# Altium project AUTOLOG_PCB.PrjPcb
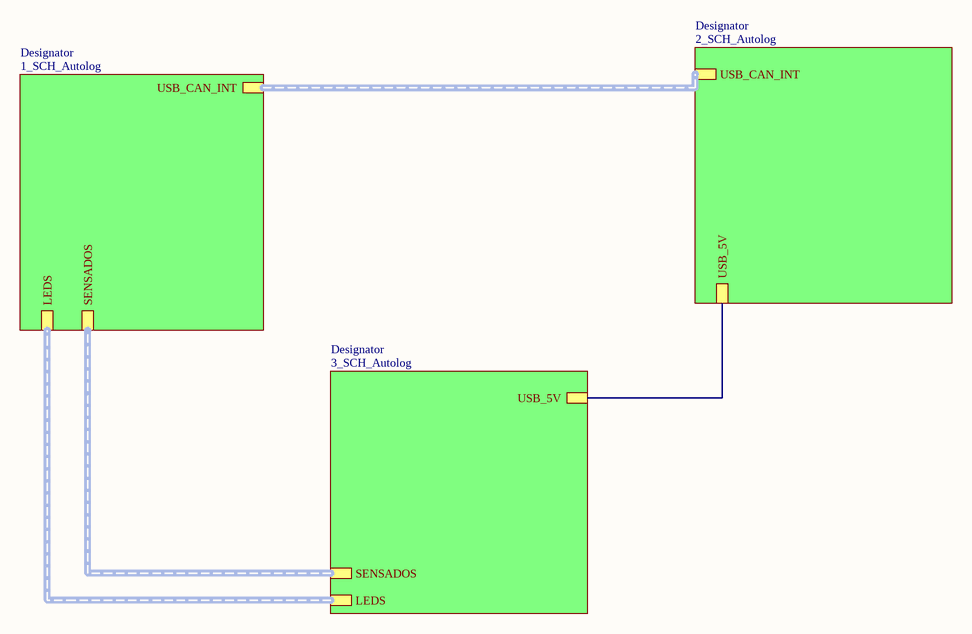
[diagram p0: Maiin.SchDoc]
4 sheets, 80 parts. Net scope: hierarchical (ports join the sheet entries above them; power ports are global).
Board file: PCB_Autolog.PcbDoc
Sheets:
  Maiin.SchDoc
    Designator = 1_SCH_Autolog.SchDoc
    Designator = 2_SCH_Autolog.SchDoc
    Designator = 3_SCH_Autolog.SchDoc

## Sheet Maiin.SchDoc: PROYECTO FINAL - AutoLog
size A4; Author: Nathalia Mora; Revision: V1R1; SheetNumber: 1; SheetTotal: 4; Name:: Marlyn Nathalia Mora Riascos

### Sub-sheets
Designator = 1_SCH_Autolog: LEDS (harness LEDS_HARNEERS), SENSADOS (harness SENSADO HARNEERS), USB_CAN_INT (harness USB_CAN_INT_HARNEERS)
Designator = 2_SCH_Autolog: USB_5V, USB_CAN_INT (harness USB_CAN_INT_HARNEERS)
Designator = 3_SCH_Autolog: LEDS (harness LEDS_HARNEERS), SENSADOS (harness SENSADO HARNEERS), USB_5V

### Nets
VBUSS: sheet Designator/USB_5V, sheet Designator/USB_5V

### Notes on the sheet
- Title
- Size:
- Date:
- A4
- Number:
- Time:
- Revision:
- Sheet
- of
- Name:
- Marlyn Nathalia Mora Riascos

## Sheet 1_SCH_Autolog.SchDoc: PROYECTO FINAL - AutoLog
size A4; Revision: V1R1; SheetNumber: 2; SheetTotal: 4
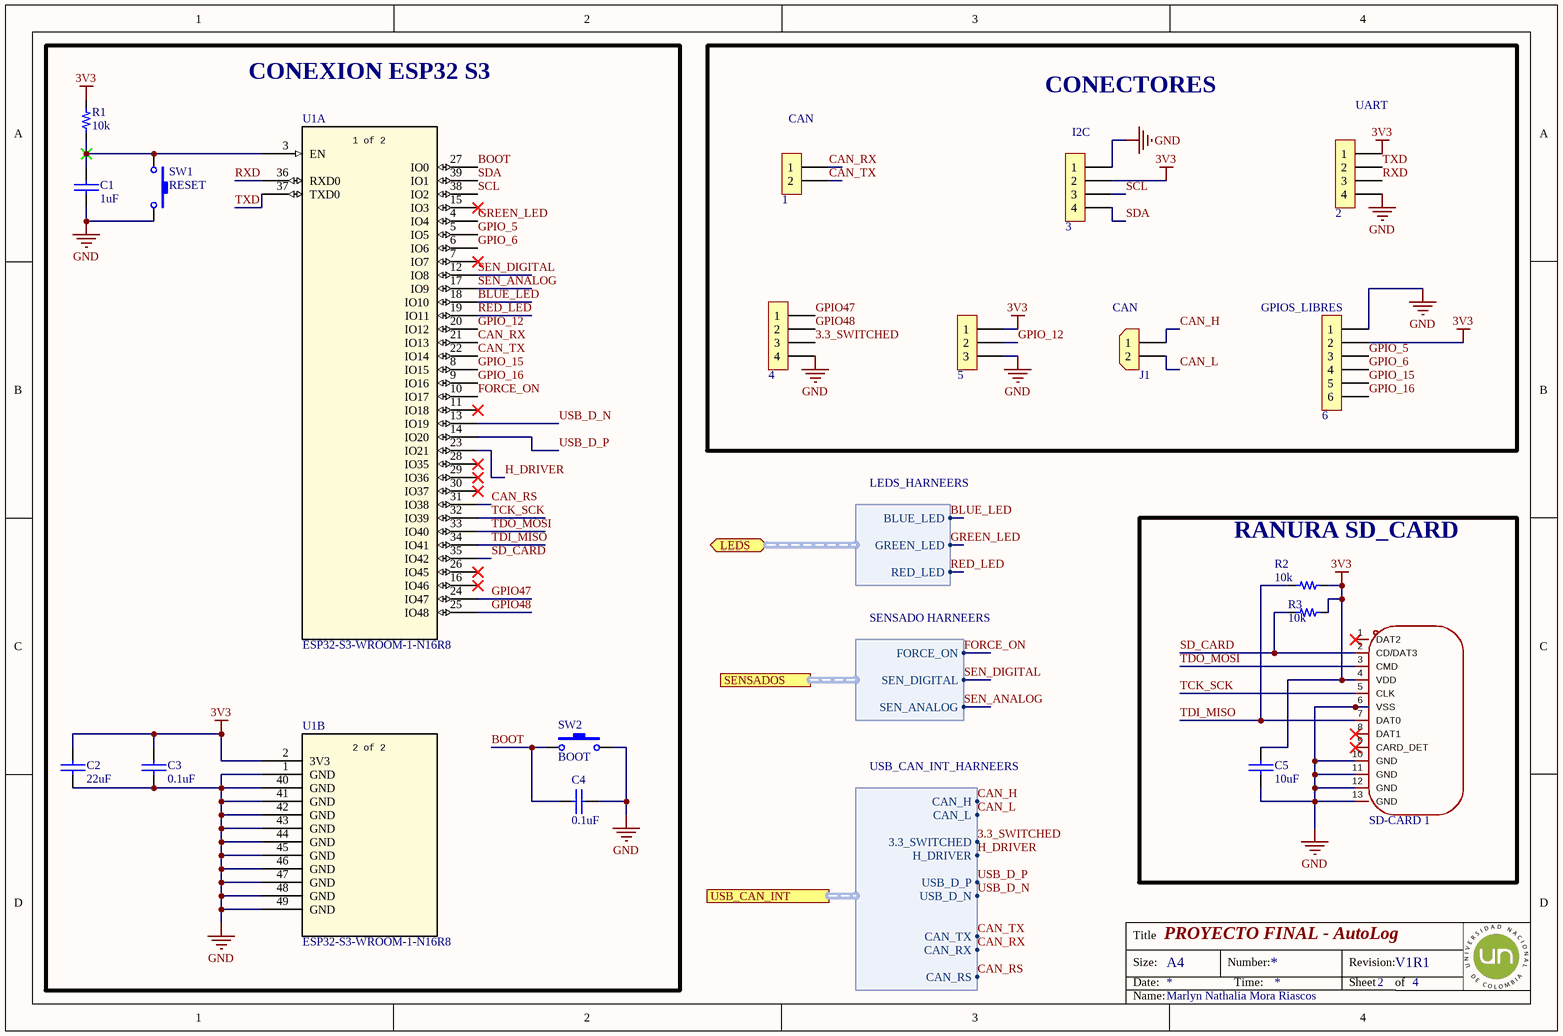
[diagram p1: 1_SCH_Autolog.SchDoc]

### Parts
1  2x1  [H_2x1_TH_100mil]  (value not drawn)  (no BOM)
2  4x1  [H_4x1_TH_2.54mm]  (value not drawn)  (no BOM)
3  4x1  [H_4x1_TH_2.54mm]  (value not drawn)  (no BOM)
4  4x1  [H_4x1_TH_2.54mm]  (value not drawn)  (no BOM)
5  3x1  [H_3X1_TH_100mil]  (value not drawn)  (no BOM)
6  6x1  [H_6x1_TH_100mil]  (value not drawn)  (no BOM)
C1  value 1uF  [0603_cap]  (hidden comment: 1uF 50V)
C2  value 22uF  [0805_cap]  (hidden comment: 22uF 16V)
C3  value 0.1uF  [0603_cap]  (hidden comment: 0.1uF 50V)
C4  value 0.1uF  [0603_cap]  (hidden comment: 0.1uF 50V)
C5  value 10uF  [0603_cap]  (hidden comment: 10uF 10V)
J1  CAN  [CON_2x1_TH_5MM]
R1  value 10k  [0603_res]  (hidden comment: 10k 1/10W)
R2  value 10k  [0603_res]  (hidden comment: 10k 1/10W)
R3  value 10k  [0603_res]  (hidden comment: 10k 1/10W)
SD-CARD_1  Micro_SD_socket  [MICROSD CARD SMD]  (value not drawn)
SW1  RESET  [Sw_PUSH_4.5x4.5x5mm]
SW2  BOOT  [Sw_PUSH_4.5x4.5x5mm]
U1  ESP32-S3-WROOM-1-N16R8  [ESP32S3WROOM1N8R2]  (parts A,B of 2)

### Blocks framed on the sheet
CONEXION ESP32 S3: C1-C4 R1 SW1 SW2 U1
CONECTORES: 1-6 J1
RANURA SD_CARD: C5 R2 R3 SD-CARD_1

### Ports
LEDS (bidir, harness LEDS_HARNEERS, see Maiin[2B], 3_SCH_Autolog[4C]), SENSADOS (harness SENSADO HARNEERS, see Maiin[2B], 3_SCH_Autolog[3A]), USB_CAN_INT (harness USB_CAN_INT_HARNEERS, see Maiin[2A], 2_SCH_Autolog[1D])

### Harnesses
LEDS_HARNEERS: RED_LED, GREEN_LED, BLUE_LED
SENSADO HARNEERS: FORCE_ON, SEN_DIGITAL, SEN_ANALOG
USB_CAN_INT_HARNEERS: USB_D_P, USB_D_N, H_DRIVER, 3.3_SWITCHED, CAN_L, CAN_TX, CAN_RX, CAN_RS, CAN_H

### Nets
3V3: 2.1 3.2 5.1 6.2 C2.1 C3.1 C5.2 R1.2 R2.2 R3.2 SD-CARD_1.4(VDD) U1.2(3V3)
GND: 2.4 3.1 4.4 5.3 6.1 C1.2 C2.2 C3.2 C4.1 C5.1 SD-CARD_1.6(VSS) SD-CARD_1.10(GND) SD-CARD_1.11(GND) SD-CARD_1.12(GND) SD-CARD_1.13(GND) SW1.2 SW2.2 U1.1(GND) U1.40(GND) U1.41(GND) U1.42(GND) U1.43(GND) U1.44(GND) U1.45(GND) U1.46(GND) U1.47(GND) U1.48(GND) U1.49(GND)
3.3_SWITCHED: 4.3 ; port USB_CAN_INT.3.3_SWITCHED
BLUE_LED: U1.18(IO10) ; port LEDS.BLUE_LED
BOOT: C4.2 SW2.1 U1.27(IO0)
CAN_H: J1.1 ; port USB_CAN_INT.CAN_H
CAN_L: J1.2 ; port USB_CAN_INT.CAN_L
CAN_RS: U1.31(IO38) ; port USB_CAN_INT.CAN_RS
CAN_RX: 1.1 U1.21(IO13) ; port USB_CAN_INT.CAN_RX
CAN_TX: 1.2 U1.22(IO14) ; port USB_CAN_INT.CAN_TX
FORCE_ON: U1.10(IO17) ; port SENSADOS.FORCE_ON
GPIO47: 4.1 U1.24(IO47)
GPIO48: 4.2 U1.25(IO48)
GPIO_5: 6.3 U1.5(IO5)
GPIO_6: 6.4 U1.6(IO6)
GPIO_12: 5.2 U1.20(IO12)
GPIO_15: 6.5 U1.8(IO15)
GPIO_16: 6.6 U1.9(IO16)
GREEN_LED: U1.4(IO4) ; port LEDS.GREEN_LED
H_DRIVER: U1.23(IO21) ; port USB_CAN_INT.H_DRIVER
RED_LED: U1.19(IO11) ; port LEDS.RED_LED
RXD: 2.3 U1.36(RXD0)
SCL: 3.3 U1.38(IO2)
SD_CARD: R3.1 SD-CARD_1.2(CD/DAT3) U1.35(IO42)
SDA: 3.4 U1.39(IO1)
SEN_ANALOG: U1.17(IO9) ; port SENSADOS.SEN_ANALOG
SEN_DIGITAL: U1.12(IO8) ; port SENSADOS.SEN_DIGITAL
TCK_SCK: SD-CARD_1.5(CLK) U1.32(IO39)
TDI_MISO: R2.1 SD-CARD_1.7(DAT0) U1.34(IO41)
TDO_MOSI: SD-CARD_1.3(CMD) U1.33(IO40)
TXD: 2.2 U1.37(TXD0)
USB_D_N: U1.13(IO19) ; port USB_CAN_INT.USB_D_N
USB_D_P: U1.14(IO20) ; port USB_CAN_INT.USB_D_P
NetC1_1: C1.1 R1.1 SW1.1 U1.3(EN)

Not connected (* = marked no-connect by the designer): SD-CARD_1 1(DAT2)* 8(DAT1)* 9(CARD_DET)*; U1 7(IO7)* 11(IO18)* 15(IO3)* 16(IO46)* 26(IO45)* 28(IO35)* 29(IO36)* 30(IO37)*

### Notes on the sheet
- (near 2) UART
- (near 1) CAN
- (near 3) I2C
- (near 6) GPIOS_LIBRES
- Title
- Size:
- Date:
- A4
- Number:
- Time:
- Revision:
- Sheet
- of
- Name:
- Marlyn Nathalia Mora Riascos
- (in symbol ESP32-S3-WROOM-1-N16R8  nnnnn, part A) 1 of 2
- (in symbol ESP32-S3-WROOM-1-N16R8  nnnnn, part B) 2 of 2

### Library data of the parts
1 = H_Male_2x1_TH_100mil: ComponentLink1Description: LCSC
2-4 = H_Male_4x1_TH_100mil: ComponentLink1Description: LCSC
5 = H_Male_3x1_TH_100mil: ComponentLink1Description: LCSC
6 = H_Male_6x1_TH_100mil: ComponentLink1Description: LCSC
C1 = Cap_1uF_0603_50V: 50V 1uF X5R ±10% 0603 Multilayer Ceramic Capacitors MLCC - SMD/SMT ROHS; Manufacturer: Samsung Electro-Mechanics; Manufacturer Part Number: CL10A105KB8NNNC; Supplier 1: LCSC; Supplier Part Number 1: C15849; ComponentLink1Description: LCSC; ComponentLink1URL: https://www.lcsc.com/product-detail/Multilayer-Ceramic-Capacitors-MLCC-SMD-SMT_Samsung-Electro-Mechanics-CL10A105KB8NNNC_C15849.html; ComponentLink2Description: Datashhet; ComponentLink2URL: https://www.lcsc.com/datasheet/C15849.pdf
C2 = Cap_22uF_0805_16V: 16V 22uF X5R ±20% 0805 Multilayer Ceramic Capacitors MLCC - SMD/SMT ROHS; Manufacturer: Chinocera; Manufacturer Part Number: HGC0805R5226M160NSLJ; Supplier 1: LCSC; Supplier Part Number 1: C33546008; ComponentLink1Description: LCSC; ComponentLink1URL: https://lcsc.com/product-detail/Multilayer-Ceramic-Capacitors-MLCC-SMD-SMT_Chinocera-HGC0805R5226M160NSLJ_C33546008.html
C3 C4 = Cap_0.1uF_0603_50V: 50V 100nF Y5V -20%~+80% 0603 Multilayer Ceramic Capacitors MLCC - SMD/SMT ROHS; Manufacturer: Walsin Tech Corp; Manufacturer Part Number: 0603F104Z500CT; Supplier 1: LCSC; Supplier Part Number 1: C83060; ComponentLink1Description: LCSC; ComponentLink1URL: https://www.lcsc.com/product-detail/Multilayer-Ceramic-Capacitors-MLCC-SMD-SMT_Walsin-Tech-Corp-0603F104Z500CT_C83060.html
  C3: ComponentLink2Description: Datasheet; ComponentLink2URL: https://www.lcsc.com/datasheet/C83060.pdf
C5 = Cap_10uF_0603_10V: 10V 10uF X5R ±10% 0603 Multilayer Ceramic Capacitors MLCC - SMD/SMT ROHS; Manufacturer: CCTC; Manufacturer Part Number: TCC0603X5R106K100CT; Supplier 1: LCSC; Supplier Part Number 1: C380314; ComponentLink1Description: LCSC; ComponentLink1URL: https://www.lcsc.com/product-detail/Multilayer-Ceramic-Capacitors-MLCC-SMD-SMT_CCTC-TCC0603X5R106K100CT_C380314.html
J1 = Con_2x1_TH_5mm: 2POS 5MM; Manufacturer: JILN; Manufacturer Part Number: JL126-50002G01; Supplier 1: LCSC; Supplier Part Number 1: C394556; ComponentLink1Description: LCSC; ComponentLink1URL: https://www.lcsc.com/product-detail/Screw-terminal_JILN-JL126-50002G01_C394556.html; ComponentLink2Description: Datasheet; ComponentLink2URL: https://www.lcsc.com/datasheet/C394556.pdf
R1-R3 = Res_10k_0603_1/10W: RES SMD 10k OHM 5% 1/10W 0603; Manufacturer: FOJAN; Manufacturer Part Number: FRC0603J103TS; ComponentLink1URL: https://www.lcsc.com/product-detail/Chip-Resistor-Surface-Mount_FOJAN-FRC0603J103TS_C2930027.html; Supplier 1: LCSC; Supplier Part Number 1: C2930027; ComponentLink1Description: LCSC; ComponentLink2Description: Datasheet; ComponentLink2URL: https://www.lcsc.com/datasheet/C2930027.pdf
SD-CARD_1 = Micro_SD_socket: CONN MICROSD CARD R/A SMD; Manufacturer: ATOM; Manufacturer Part Number: MR01A-01211; Supplier 1: LSCS; Supplier Part Number 1: C479742; ComponentLink1Description: LSCS; ComponentLink1URL: https://www.lcsc.com/product-detail/Card-Sockets-Connectors_ATOM-MR01A-01211_C479742.html; ComponentLink2Description: Datasheet; ComponentLink2URL: https://www.lcsc.com/datasheet/C479742.pdf
SW1 SW2 = Sw_PUSH_4.5x4.5x5.0xmm: SWITCH TACTILE SPST-NO 0.05A 12V; Manufacturer: BZCN; Manufacturer Part Number: TSC015A05026A; Supplier 1: LCSC; Supplier Part Number 1: C2888509; Last modified by: N-A.Potosi; Last modified date: 20190222; ComponentLink1Description: LCSC; ComponentLink1URL: https://www.lcsc.com/product-detail/Tactile-Switches_BZCN-TSC015A05026A_C2888509.html
U1 = ESP32-S3-WROOM-1-N16R8  nnnnn: ESP32-S3 Wi-Fi & Bluetooth 5 MCU module, 16MB Flash, 8MB PSRAM.; Manufacturer: Espressif Systems; Suplier  Part Number: 5407-ESP32-S3-WROOM-1-N16R8TR-ND; Manufacturer product number: ESP32-S3-WROOM-1-N16R8; ComponentLink1Description: DataSheep; ComponentLink1URL: https://documentation.espressif.com/esp32-s3-wroom-1_wroom-1u_datasheet_en.pdf; Supplier 1: Digi-Key; ComponentLink2Description: Digi-Key; ComponentLink2URL: https://www.digikey.com/en/products/detail/espressif-systems/ESP32-S3-WROOM-1-N16R8/16162642

## Sheet 2_SCH_Autolog.SchDoc: PROYECTO FINAL - AutoLog
size A4; SheetNumber: 3; SheetTotal: 4
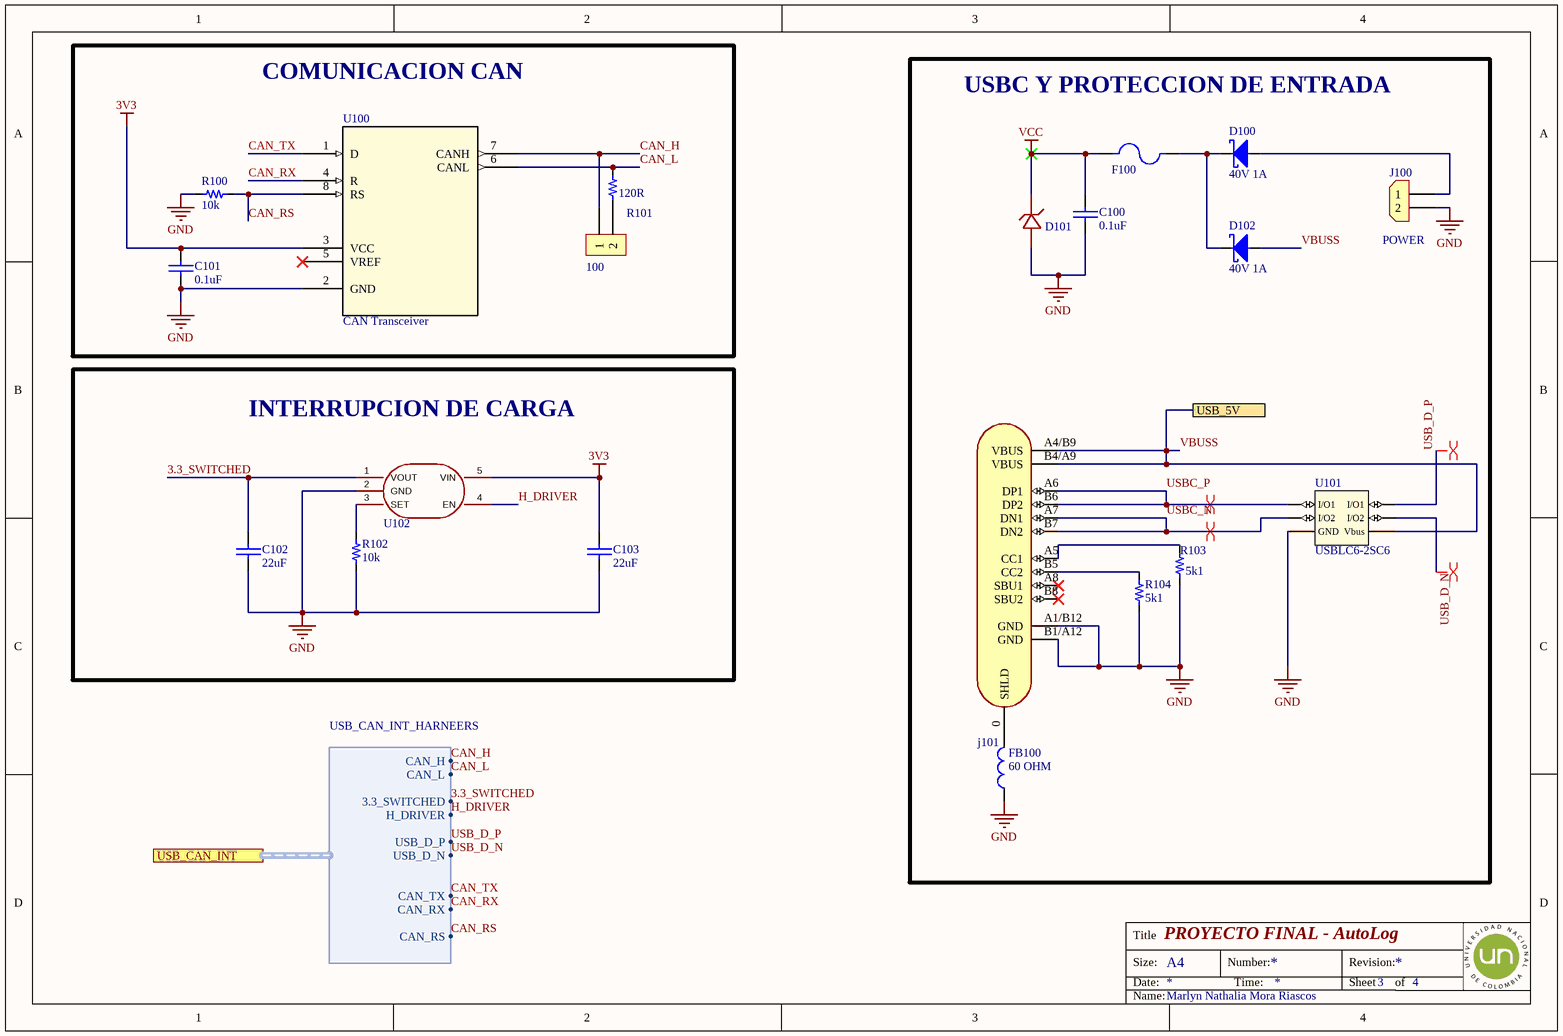
[diagram p2: 2_SCH_Autolog.SchDoc]

### Parts
100  2x1  [H_2x1_TH_100mil]  (value not drawn)  (no BOM)
C100  value 0.1uF  [0603_cap]  (hidden comment: 0.1uF 50V)
C101  value 0.1uF  [0603_cap]  (hidden comment: 0.1uF 50V)
C102  value 22uF  [0603_cap]  (hidden comment: 22uF 10V)
C103  value 22uF  [0603_cap]  (hidden comment: 22uF 10V)
D100  40V 1A  [SOD_123]
D101  TVS_DIODE_SMF30A  [TVS_DIODE_SMF30A]  (value not drawn)
D102  40V 1A  [SOD_123]
F100  PTC_MF-MSMF110/16-2  [FUSER_MF-MSMF110/16-2]  (value not drawn)
FB100  value 60 OHM  [0603_fb]  (hidden comment: 60OHM 2A)
J100  POWER  [CON_2x1_TH_5MM]
j101  USB C  [CON_USB_C_16P_RA]  (value not drawn)
R100  value 10k  [0603_res]  (hidden comment: 10k 1/10W)
R101  value 120R  [0603_res]  (hidden comment: 120R 1/10W)
R102  value 10k  [0603_res]  (hidden comment: 10k 1/10W)
R103  value 5k1  [0603_res]  (hidden comment: 5k1 1/10W)
R104  value 5k1  [0603_res]  (hidden comment: 5k1 1/10W)
U100  CAN Transceiver  [D8-M]
U101  USBLC6-2SC6  [SOT_23_6]
U102  MT9700  [SOT-23-5_L3.0-W1.7-P0.95-LS2.8-BR]  (value not drawn)

### Blocks framed on the sheet
COMUNICACION CAN: 100 C101 R100 R101 U100
USBC Y PROTECCION DE ENTRADA: C100 D100-D102 F100 FB100 J100 j101 R103 R104 U101
INTERRUPCION DE CARGA: C102 C103 R102 U102

### Ports
USB_5V (see Maiin[3B], 3_SCH_Autolog[3A]), USB_CAN_INT (harness USB_CAN_INT_HARNEERS, see Maiin[3A], 1_SCH_Autolog[2D])

### Harnesses
USB_CAN_INT_HARNEERS: USB_D_P, USB_D_N, H_DRIVER, 3.3_SWITCHED, CAN_L, CAN_TX, CAN_RX, CAN_RS, CAN_H

### Nets
3V3: C101.2 C103.1 U100.3(VCC) U102.5(VIN)
GND: C100.1 C101.1 C102.2 C103.2 D101.2 FB100.1 J100.2 j101.A1/B12(GND) j101.B1/A12(GND) R100.1 R102.1 R103.1 R104.2 U100.2(GND) U101.2(GND) U102.2(GND)
VCC: C100.2 D101.1 F100.1
3.3_SWITCHED: C102.1 U102.1(VOUT) ; port USB_CAN_INT.3.3_SWITCHED
CAN_H: 100.1 U100.7(CANH) ; port USB_CAN_INT.CAN_H
CAN_L: R101.2 U100.6(CANL) ; port USB_CAN_INT.CAN_L
CAN_RS: R100.2 U100.8(RS) ; port USB_CAN_INT.CAN_RS
CAN_RX: U100.4(R) ; port USB_CAN_INT.CAN_RX
CAN_TX: U100.1(D) ; port USB_CAN_INT.CAN_TX
H_DRIVER: U102.4(EN) ; port USB_CAN_INT.H_DRIVER
USB_D_N: U101.4(I/O2) ; port USB_CAN_INT.USB_D_N
USB_D_P: U101.6(I/O1) ; port USB_CAN_INT.USB_D_P
USBC_N: j101.A7(DN1) j101.B7(DN2) U101.3(I/O2)
USBC_P: j101.A6(DP1) j101.B6(DP2) U101.1(I/O1)
VBUSS: D102.2 j101.A4/B9(VBUS) j101.B4/A9(VBUS) U101.5(Vbus) ; port USB_5V
Net100_2: 100.2 R101.1
NetD100_1: D100.1 D102.1 F100.2
NetD100_2: D100.2 J100.1
NetFB100_2: FB100.2 j101.0(SHLD)
Netj101_A5: j101.A5(CC1) R103.2
Netj101_B5: j101.B5(CC2) R104.1
NetR102_2: R102.2 U102.3(SET)

Not connected (* = marked no-connect by the designer): j101 A8(SBU1)* B8(SBU2)*; U100 5(VREF)*

### Layout directives
differential pair: USB_D_N, USB_D_P, USBC_N, USBC_P

### Notes on the sheet
- Title
- Size:
- Date:
- A4
- Number:
- Time:
- Revision:
- Sheet
- of
- Name:
- Marlyn Nathalia Mora Riascos

### Library data of the parts
100 = H_Male_2x1_TH_100mil: ComponentLink1Description: LCSC
C100 C101 = Cap_0.1uF_0603_50V: as C3 on sheet 1_SCH_Autolog; Supplier 1: LCSC; Supplier Part Number 1: C83060; ComponentLink1Description: LCSC; ComponentLink1URL: https://www.lcsc.com/product-detail/Multilayer-Ceramic-Capacitors-MLCC-SMD-SMT_Walsin-Tech-Corp-0603F104Z500CT_C83060.html; ComponentLink2Description: Datasheet; ComponentLink2URL: https://www.lcsc.com/datasheet/C83060.pdf
C102 C103 = Cap_22uF_0603_10V: 10V 22uF X5R ±20% 0603 Multilayer Ceramic Capacitors MLCC - SMD/SMT ROHS; Manufacturer: HRE; Manufacturer Part Number: CGA0603X5R226M100JT; Supplier 1: LCSC; Supplier Part Number 1: C6119863; ComponentLink1Description: LCSC; ComponentLink1URL: https://lcsc.com/product-detail/Multilayer-Ceramic-Capacitors-MLCC-SMD-SMT_HRE-CGA0603X5R226M100JT_C6119863.html; ComponentLink2Description: Datasheet; ComponentLink2URL: https://www.lcsc.com/datasheet/C6119863.pdf
D100 D102 = D_Schottky_40V_1A_SOD_123F: DIODE SCHOTTKY 40V 1A SOD123F; Manufacturer: Shanghai Prisemi Elec; Manufacturer Part Number: PSBD1DF40V1H; Supplier 1: LCSC; Supplier Part Number 1: C110730; ComponentLink1Description: LCSC; ComponentLink1URL: https://www.lcsc.com/product-detail/Switching-Diode_Shanghai-Prisemi-Elec-PSBD1DF40V1H_C110730.html; ComponentLink2Description: Datasheet; ComponentLink2URL: https://www.lcsc.com/datasheet/C110730.pdf
D101 = TVS_DIODE_SMF30A: TVS DIODE 30VWM 48.4VC SOD123F; Manufacturer: Diotec Semiconductor; Manufacturer Part Number: SMF30A; Supplier 1: digikey; Supplier Part Number 1: 4878-SMF30ATR-ND; ComponentLink1Description: digikey; ComponentLink1URL: https://www.digikey.com/en/products/detail/diotec-semiconductor/SMF30A/13164473; ComponentLink2Description: Datasheet; ComponentLink2URL: https://diotec.com/request/datasheet/smf50a.pdf
F100 = PTC_MF-MSMF110/16-2: Polymeric PTC Resettable Fuse 16V 1.1 A Ih Surface Mount 1812 (4532 Metric), Concave; Manufacturer: Bourns Inc.; Manufacturer Part Number: MF-MSMF110/16-2; Supplier 1: digikey; Supplier Part Number 1: MF-MSMF110/16-2TR-ND; ComponentLink1Description: digikey; ComponentLink1URL: https://www.digikey.com/en/products/detail/bourns-inc/MF-MSMF110-16-2/662820?s=N4IgTCBcDaIEIHkCqAlAcgZQAQFkBiAtDhvgIykAMA9KQGwEQC6AvkA; ComponentLink2Description: Datasheet; ComponentLink2URL: https://www.bourns.com/docs/product-datasheets/mf-msmf.pdf
FB100 = FB_60_0603_2A: 2A 1 100mΩ 60Ω@100MHz ±25% 0603 Ferrite Beads ROHS; Manufacturer: TAI-TECH; Manufacturer Part Number: HCB1608KF-600T20; ComponentLink1Description: LCSC; ComponentLink1URL: https://www.lcsc.com/product-detail/Ferrite-Beads_TAI-TECH-HCB1608KF-600T20_C369516.html; Supplier 1: LCSC; Supplier Part Number 1: C369516
J100 = Con_2x1_TH_5mm: as J1 on sheet 1_SCH_Autolog; Supplier 1: LCSC; Supplier Part Number 1: C394556; ComponentLink1Description: LCSC; ComponentLink1URL: https://www.lcsc.com/product-detail/Screw-terminal_JILN-JL126-50002G01_C394556.html; ComponentLink2Description: Datasheet; ComponentLink2URL: https://www.lcsc.com/datasheet/C394556.pdf
j101 = CON_USB_TYPEC_16P: 3A USB 3.1 1 Surface Mount 16P Female -40℃~+85℃ Type-C SMD USB Connectors ROHS; Manufacturer: SHOU HAN; Manufacturer Part Number: TYPE-C-3.1-16PIN; Supplier 1: LCSC; Supplier Part Number 1: C7507405; ComponentLink1Description: LCSC; ComponentLink1URL: https://lcsc.com/product-detail/USB-Connectors_SHOU-HAN-TYPE-C-3-1-16PIN_C7507405.html; ComponentLink2Description: Datasheet
R100 R102 = Res_10k_0603_1/10W: as R1 on sheet 1_SCH_Autolog; ComponentLink1URL: https://www.lcsc.com/product-detail/Chip-Resistor-Surface-Mount_FOJAN-FRC0603J103TS_C2930027.html; Supplier 1: LCSC; Supplier Part Number 1: C2930027; ComponentLink1Description: LCSC; ComponentLink2Description: Datasheet; ComponentLink2URL: https://www.lcsc.com/datasheet/C2930027.pdf
R101 = Res_120R_0603_1/10W: 100mW Thick Film Resistor 75V ±100ppm/℃ ±1% 120Ω 0603 Chip Resistor - Surface Mount ROHS; Manufacturer: FOJAN; Manufacturer Part Number: FRC0603F1200TS; ComponentLink1URL: https://lcsc.com/product-detail/Chip-Resistor-Surface-Mount_FOJAN-FRC0603F1200TS_C2906988.html; Supplier 1: LCSC; Supplier Part Number 1: C2906988; ComponentLink1Description: LCSC; ComponentLink2Description: Datasheet; ComponentLink2URL: https://www.lcsc.com/datasheet/C2906988.pdf
R103 R104 = Res_5k1_0603: RES 5.1kΩ ±1% 100mW 0603; Manufacturer: YAGEO; Manufacturer Part Number: RC0603FR-0773K2L; ComponentLink1URL: https://www.lcsc.com/product-detail/Chip-Resistor-Surface-Mount_UNI-ROYAL-Uniroyal-Elec-0603W8F5101T5E_C23186.html; Supplier 1: LCSC; Supplier Part Number 1: C163420; ComponentLink1Description: LCSC
U100 = SN65HVD230DR-CAN: Transceiver Half CANbus 8-SOIC; Manufacturer: Texas Instruments; Suplier  Part Number: 296-11654-2-ND; Manufacturer product number: SN65HVD230DR; ComponentLink1Description: DataSheep; ComponentLink1URL: https://www.ti.com/lit/ds/symlink/sn65hvd230.pdf?HQS=dis-dk-null-digikeymode-dsf-pf-null-wwe&ts=1793387216556&ref_url=https%253A%252F%252Fwww.ti.com%252Fgeneral%252Fdocs%252Fsuppproductinfo.tsp%253FdistId%253D10%2526gotoUrl%253Dhttps%253A%252F%252Fwww.ti.com%252Flit%252Fgpn%252Fsn65hvd230; Supplier 1: Digi-Key; ComponentLink2Description: Digi-Key; ComponentLink2URL: https://www.digikey.com/en/products/detail/texas-instruments/SN65HVD230DR/404367
U101 = TVS_5.25V_2CH_SOT_23_6: TVS DIODE 5.25V 17V SOT23-6; Manufacturer: STMicroelectronics; ComponentLink1Description: LCSC; ComponentLink1URL: https://www.lcsc.com/product-detail/ESD-Protection-Devices_STMicroelectronics-USBLC6-2SC6_C7519.html; Supplier 1: LCSC; Manufacturer Part Number: USBLC6-2SC6; Supplier Part Number 1: C7519
U102 = MT9700: Switch de potencia con límite de corriente y control enable para corte en sleep de periféricos y MicroSD; Manufacturer: XI'AN Aerosemi Tech; Manufacturer Part Number: MT9700; Supplier 1: LCSC; Supplier Part Number 1: C89855; ComponentLink1Description: LCSC; ComponentLink1URL: https://www.lcsc.com/product-detail/C89855.html?s_z=n_q_MT9700%2520SOT-23-5; ComponentLink2Description: Datasheet; ComponentLink2URL: https://www.lcsc.com/datasheet/C89855.pdf

## Sheet 3_SCH_Autolog.SchDoc: PROYECTO FINAL - AutoLog
size A4; Revision: V1R1; SheetNumber: 4; SheetTotal: 4
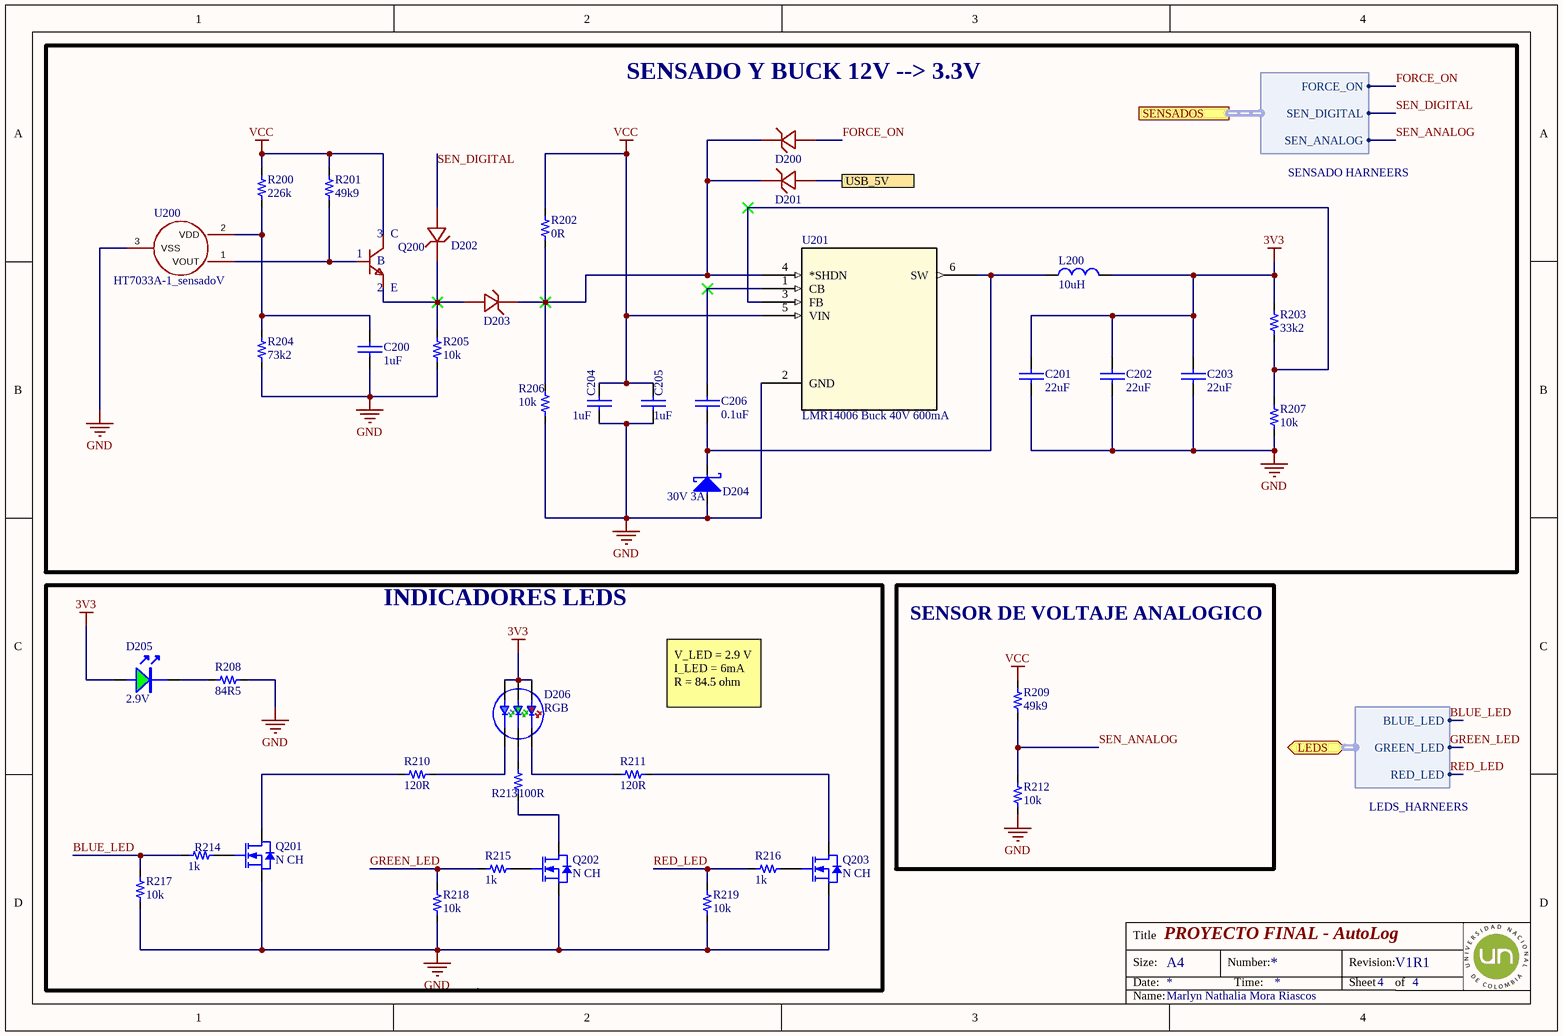
[diagram p3: 3_SCH_Autolog.SchDoc]

### Parts
C200  value 1uF  [0603_cap]  (hidden comment: 1uF 50V)
C201  value 22uF  [0603_cap]  (hidden comment: 22uF 10V)
C202  value 22uF  [0603_cap]  (hidden comment: 22uF 10V)
C203  value 22uF  [0603_cap]  (hidden comment: 22uF 10V)
C204  value 1uF  [0603_cap]  (hidden comment: 1uF 50V)
C205  value 1uF  [0603_cap]  (hidden comment: 1uF 50V)
C206  value 0.1uF  [0603_cap]  (hidden comment: 0.1uF 50V)
D200  1N4148WS  [SOD-323_1N4148]  (value not drawn)
D201  1N4148WS  [SOD-323_1N4148]  (value not drawn)
D202  1N4148WS  [SOD-323_1N4148]  (value not drawn)
D203  1N4148WS  [SOD-323_1N4148]  (value not drawn)
D204  30V 3A  [SMA]
D205  2.9V  [0805_LED]
D206  RGB  [RGB_NS_3.5X3.7]
L200  value 10uH  [Ind_5.8*5.2_NS]  (hidden comment: 10uH 1.42A)
Q200  SS8050  [SOT-23-3_TRANS NPN]  (value not drawn)
Q201  N CH  [SOT_23_3]
Q202  N CH  [SOT_23_3]
Q203  N CH  [SOT_23_3]
R200  value 226k  [0603_res]  (hidden comment: 226k 1/10W)
R201  value 49k9  [0603_res]  (hidden comment: 49k9 1/10W)
R202  value 0R  [0603_res]  (hidden comment: 0R 1/10W)
R203  value 33k2  [0603_res]  (hidden comment: 33k2 1/10W)
R204  value 73k2  [0603_res]  (hidden comment: 73k2 1/10W)
R205  value 10k  [0603_res]  (hidden comment: 10k 1/10W)
R206  value 10k  [0603_res]  (hidden comment: 10k 1/10W)
R207  value 10k  [0603_res]  (hidden comment: 10k 1/10W)
R208  value 84R5  [0603_res]  (hidden comment: 84R5 1/10W)
R209  value 49k9  [0603_res]  (hidden comment: 49k9 1/10W)
R210  value 120R  [0603_res]  (hidden comment: 120R 1/10W)
R211  value 120R  [0603_res]  (hidden comment: 120R 1/10W)
R212  value 10k  [0603_res]  (hidden comment: 10k 1/10W)
R213  value 100R  [0603_res]  (hidden comment: 100R 1/10W)
R214  value 1k  [0603_res]  (hidden comment: 1k 1/10W)
R215  value 1k  [0603_res]  (hidden comment: 1k 1/10W)
R216  value 1k  [0603_res]  (hidden comment: 1k 1/10W)
R217  value 10k  [0603_res]  (hidden comment: 10k 1/10W)
R218  value 10k  [0603_res]  (hidden comment: 10k 1/10W)
R219  value 10k  [0603_res]  (hidden comment: 10k 1/10W)
U200  HT7033A-1_sensadoV  [SOT-89-3_L4.5-W2.5-P1.50-LS4.2-BR]
U201  LMR14006 Buck 40V 600mA  [DDC6_TEX-M]

### Blocks framed on the sheet
SENSADO Y BUCK 12V --> 3.3V: C200-C206 D200-D204 L200 Q200 R200-R207 U200 U201
INDICADORES LEDS: D205 D206 Q201-Q203 R208 R210 R211 R213-R219
SENSOR DE VOLTAJE ANALOGICO: R209 R212

### Ports
LEDS (bidir, harness LEDS_HARNEERS, see Maiin[2C], 1_SCH_Autolog[2C]), SENSADOS (harness SENSADO HARNEERS, see Maiin[2C], 1_SCH_Autolog[2C]), USB_5V (see Maiin[3C], 2_SCH_Autolog[4B])

### Harnesses
LEDS_HARNEERS: RED_LED, GREEN_LED, BLUE_LED
SENSADO HARNEERS: FORCE_ON, SEN_DIGITAL, SEN_ANALOG

### Nets
3V3: C201.1 C202.1 C203.1 D205.1(A) D206.4 D206.5 D206.6 L200.2 R203.2
GND: C200.2 C201.2 C202.2 C203.2 C204.2 C205.2 D204.2 Q201.2(S) Q202.2(S) Q203.2(S) R204.1 R205.1 R206.1 R207.1 R208.2 R212.1 R217.2 R218.1 R219.1 U200.3(VSS) U201.2(GND)
VCC: C204.1 C205.1 Q200.3(C) R200.2 R201.1 R202.2 R209.2 U201.5(VIN)
BLUE_LED: R214.1 R217.1 ; port LEDS.BLUE_LED
FORCE_ON: D200.2 ; port SENSADOS.FORCE_ON
GREEN_LED: R215.1 R218.2 ; port LEDS.GREEN_LED
RED_LED: R216.1 R219.2 ; port LEDS.RED_LED
SEN_ANALOG: R209.1 R212.2 ; port SENSADOS.SEN_ANALOG
SEN_DIGITAL: D202.2 ; port SENSADOS.SEN_DIGITAL
VBUSS: D201.2 ; port USB_5V
NetC200_1: C200.1 R200.1 R204.2 U200.2(VDD)
NetC206_1: C206.1 U201.1(CB)
NetC206_2: C206.2 D204.1 L200.1 U201.6(SW)
NetD200_1: D200.1 D201.1 D203.1 R202.1 R206.2 U201.4(*SHDN)
NetD202_1: D202.1 D203.2 Q200.2(E) R205.2
NetD205_2: D205.2 R208.1
NetD206_1: D206.1 R210.1
NetD206_2: D206.2 R213.1
NetD206_3: D206.3 R211.1
NetQ200_1: Q200.1(B) R201.2 U200.1(VOUT)
NetQ201_1: Q201.1(G) R214.2
NetQ201_3: Q201.3(D) R210.2
NetQ202_1: Q202.1(G) R215.2
NetQ202_3: Q202.3(D) R213.2
NetQ203_1: Q203.1(G) R216.2
NetQ203_3: Q203.3(D) R211.2
NetR203_1: R203.1 R207.2 U201.3(FB)

### Notes on the sheet
- V_LED = 2.9 V
  I_LED = 6mA
  R = 84.5 ohm
- Title
- Size:
- Date:
- A4
- Number:
- Time:
- Revision:
- Sheet
- of
- Name:
- Marlyn Nathalia Mora Riascos

### Library data of the parts
C200 C204 C205 = Cap_1uF_0603_50V: as C1 on sheet 1_SCH_Autolog; Supplier 1: LCSC; Supplier Part Number 1: C15849; ComponentLink1Description: LCSC; ComponentLink1URL: https://www.lcsc.com/product-detail/Multilayer-Ceramic-Capacitors-MLCC-SMD-SMT_Samsung-Electro-Mechanics-CL10A105KB8NNNC_C15849.html
  C200: ComponentLink2Description: Datashhet; ComponentLink2URL: https://www.lcsc.com/datasheet/C15849.pdf
C201-C203 = Cap_22uF_0603_10V: as C102 on sheet 2_SCH_Autolog; Supplier 1: LCSC; Supplier Part Number 1: C6119863; ComponentLink1Description: LCSC; ComponentLink1URL: https://lcsc.com/product-detail/Multilayer-Ceramic-Capacitors-MLCC-SMD-SMT_HRE-CGA0603X5R226M100JT_C6119863.html; ComponentLink2Description: Datasheet; ComponentLink2URL: https://www.lcsc.com/datasheet/C6119863.pdf
C206 = Cap_0.1uF_0603_50V: as C3 on sheet 1_SCH_Autolog; Supplier 1: LCSC; Supplier Part Number 1: C83060; ComponentLink1Description: LCSC; ComponentLink1URL: https://www.lcsc.com/product-detail/Multilayer-Ceramic-Capacitors-MLCC-SMD-SMT_Walsin-Tech-Corp-0603F104Z500CT_C83060.html; ComponentLink2Description: Datasheet; ComponentLink2URL: https://www.lcsc.com/datasheet/C83060.pdf
D200-D203 = 1N4148WS_DIODE: DIODE GP 100V 150mA SOD-323; Manufacturer: JSCJ; Manufacturer Part Number: 1N4148WS; Supplier 1: LCSC; Supplier Part Number 1: C2128; ComponentLink1Description: JSCJ; ComponentLink1URL: https://www.lcsc.com/product-detail/Switching-Diode_JCET-1N4148WS_C2128.html; ComponentLink2Description: Datasheet; ComponentLink2URL: https://www.lcsc.com/datasheet/C2128.pdf
D204 = D_Schottky_40V_3A_SMA: 40V Independent 3A 550mV@3A SMA Schottky Diodes ROHS; Manufacturer: TDSEMIC; Manufacturer Part Number: SS34-TD; Supplier 1: LCSC; Supplier Part Number 1: C46550832; ComponentLink1Description: LCSC; ComponentLink1URL: https://lcsc.com/product-detail/Schottky-Diodes_TDSEMIC-SS34-TD_C46550832.html; ComponentLink2Description: Datasheet; ComponentLink2URL: https://www.lcsc.com/datasheet/C46550832.pdf; ComponentLink3Description: New link
D205 = LED_0805_Green: LED GREEN CLEAR 0805 SMD; Manufacturer: XINGLIGHT; Manufacturer Part Number: XL-2012UGC; Supplier 1: LCSC; Supplier Part Number 1: C965815; ComponentLink1Description: LCSC; ComponentLink1URL: https://www.lcsc.com/product-detail/Light-Emitting-Diodes-LED_XINGLIGHT-XL-2012UGC_C965815.html
D206 = LED_RGB_3535_SMD: -30℃~+85℃ RGB 110° 3535(mm) Light Emitting Diodes (LED) ROHS; Manufacturer: Foshan NationStar Optoelectronics; Manufacturer Part Number: RS-3535MWAM; Supplier 1: LCSC; Supplier Part Number 1: C842778; ComponentLink1Description: LCSC; ComponentLink1URL: https://www.lcsc.com/product-detail/Light-Emitting-Diodes-LED_Foshan-NationStar-Optoelectronics-RS-3535MWAM_C842778.html
L200 = Inductor_10uH_1.42A_5.8*5.2mm: 1.42A 10uH ±10% 87.9mΩ SMD,5.8x5.2mm Inductors (SMD) ROHS; Manufacturer: SHOU HAN; Manufacturer Part Number: CY54-10UH; Supplier 1: LCSC; Supplier Part Number 1: C2929431; ComponentLink1Description: LCSC; ComponentLink1URL: https://lcsc.com/product-detail/Inductors-SMD_SHOU-HAN-CY54-4-7UH_C2929429.html; ComponentLink2Description: Datasheet; ComponentLink2URL: https://www.lcsc.com/datasheet/C2929429.pdf
Q200 = TRANS_NPN_SS8050_SOT23: SS8050 Transistor BJT NPN 40V 1.5A; Manufacturer: JSCJ; Manufacturer Part Number: SS8050(RANGE:200-350); Supplier 1: LCSC; Supplier Part Number 1: C2150; ComponentLink1Description: LCSC; ComponentLink1URL: https://www.lcsc.com/product-detail/Bipolar-Transistors-BJT_JCET-SS8050_C2150.html; ComponentLink2Description: Datasheet; ComponentLink2URL: https://www.lcsc.com/datasheet/C2150.pdf
Q201-Q203 = Q_NFET_20V_3.2A_SOT23: MOSFET N-CH 20V SOT23; Manufacturer: Doeshare; Manufacturer Part Number: DN2302S; Supplier 1: LCSC; Supplier Part Number 1: C2931750; ComponentLink1Description: LCSC; ComponentLink1URL: https://www.lcsc.com/product-detail/MOSFETs_Doeshare-DN2302S_C2931750.html
R200 = Res_226k_0603_1/10W: 100mW Thick Film Resistors 75V ±100ppm/℃ ±1% 226kΩ 0603 Chip Resistor - Surface Mount ROHS; Manufacturer: YAGEO; Manufacturer Part Number: RC0603FR-07226KL; ComponentLink1URL: https://lcsc.com/product-detail/Chip-Resistor-Surface-Mount_YAGEO-RC0603FR-07226KL_C165744.html; Supplier 1: LCSC; Supplier Part Number 1: C165744; ComponentLink1Description: LCSC
R201 R209 = Res_49k9_0603_1/10W: 100mW Thick Film Resistor 75V ±100ppm/℃ ±1% 49.9kΩ 0603 Chip Resistor - Surface Mount ROHS; Manufacturer: YAGEO; Manufacturer Part Number: RC0603FR-0749K9L; ComponentLink1URL: https://lcsc.com/product-detail/Chip-Resistor-Surface-Mount_YAGEO-RC0603FR-0749K9L_C114624.html; Supplier 1: LCSC; Supplier Part Number 1: C114624; ComponentLink1Description: LCSC
R202 = Res_0R_0603_1/10W: RES SMD 0R OHM 5% 1/10W 0603; Manufacturer: FOJAN; Manufacturer Part Number: FRC0603P000 TS; ComponentLink1URL: https://www.lcsc.com/product-detail/Chip-Resistor-Surface-Mount_FOJAN-FRC0603P000-TS_C2907080.html; Supplier 1: LCSC; Supplier Part Number 1: C2907080; ComponentLink1Description: LCSC; ComponentLink2Description: Datasheet; ComponentLink2URL: https://www.lcsc.com/datasheet/C2907080.pdf
R203 = Res_33k2_0603_1/10W: 100mW Thick Film Resistor 75V ±100ppm/℃ ±1% 33.2kΩ 0603 Chip Resistor - Surface Mount ROHS; Manufacturer: YAGEO; Manufacturer Part Number: RC0603FR-0733K2L; ComponentLink1URL: https://lcsc.com/product-detail/Chip-Resistor-Surface-Mount_YAGEO-RC0603FR-0733K2L_C185338.html; Supplier 1: LCSC; Supplier Part Number 1: C185338; ComponentLink1Description: LCSC; ComponentLink2Description: Datasheet; ComponentLink2URL: https://www.lcsc.com/datasheet/C185338.pdf
R204 = Res_73k2_0603_1/10W: 100mW Thick Film Resistor 75V ±100ppm/℃ ±1% 73.2kΩ 0603 Chip Resistor - Surface Mount ROHS; Manufacturer: YAGEO; Manufacturer Part Number: RC0603FR-0773K2L; ComponentLink1URL: https://lcsc.com/product-detail/Chip-Resistor-Surface-Mount_YAGEO-RC0603FR-0773K2L_C163420.html; Supplier 1: LCSC; Supplier Part Number 1: C163420; ComponentLink1Description: LCSC
R205-R207 R212 R217-R219 = Res_10k_0603_1/10W: as R1 on sheet 1_SCH_Autolog; ComponentLink1URL: https://www.lcsc.com/product-detail/Chip-Resistor-Surface-Mount_FOJAN-FRC0603J103TS_C2930027.html; Supplier 1: LCSC; Supplier Part Number 1: C2930027; ComponentLink1Description: LCSC; ComponentLink2Description: Datasheet; ComponentLink2URL: https://www.lcsc.com/datasheet/C2930027.pdf
R208 = Res_84R5_0603_1/10W: 100mW Thick Film Resistor 50V ±100ppm/℃ ±1% 84.5Ω 0603 Chip Resistor - Surface Mount ROHS; Manufacturer: LIZ Elec; Manufacturer Part Number: CR0603FA84R5G; ComponentLink1URL: https://lcsc.com/product-detail/Chip-Resistor-Surface-Mount_LIZ-Elec-CR0603FA84R5G_C101216.html; Supplier 1: LCSC; Supplier Part Number 1: C101216; ComponentLink1Description: LCSC
R210 R211 = Res_120R_0603_1/10W: as R101 on sheet 2_SCH_Autolog; ComponentLink1URL: https://lcsc.com/product-detail/Chip-Resistor-Surface-Mount_FOJAN-FRC0603F1200TS_C2906988.html; Supplier 1: LCSC; Supplier Part Number 1: C2906988; ComponentLink1Description: LCSC; ComponentLink2Description: Datasheet; ComponentLink2URL: https://www.lcsc.com/datasheet/C2906988.pdf
R213 = Res_100R_0603_1/10W: RES SMD 100R OHM 5% 1/10W 0603; Manufacturer: FOJAN; Manufacturer Part Number: FRC0603J101 TS; ComponentLink1URL: https://www.lcsc.com/product-detail/Chip-Resistor-Surface-Mount_FOJAN-FRC0603J101-TS_C2907089.html; Supplier 1: LCSC; Supplier Part Number 1: C2907089; ComponentLink1Description: LCSC
R214-R216 = Res_1k_0603_1/10W: RES SMD 1k OHM 5% 1/10W 0603; Manufacturer: FOJAN; Manufacturer Part Number: FRC0603J102 TS; ComponentLink1URL: https://www.lcsc.com/product-detail/Chip-Resistor-Surface-Mount_FOJAN-FRC0603J102-TS_C2907113.html; Supplier 1: LCSC; Supplier Part Number 1: C2907113; ComponentLink1Description: LCSC; ComponentLink2Description: Datashhet; ComponentLink2URL: https://www.lcsc.com/datasheet/C2907152.pdf
U200 = HOLTEK HT7033A-1_sensadoV: Detector de tensión con umbral de 3.3V; Manufacturer: HOLTEK; Suplier  Part Number: C73715; Manufacturer product number: HT7033A-1; ComponentLink1Description: DataSheep; ComponentLink1URL: https://datasheet4u.com/download/529551/HT7033A-1.html; Supplier 1: LCSC; ComponentLink2Description: LCSC; ComponentLink2URL: https://www.lcsc.com/product-detail/C73715.html?s_z=n_q_p_HT7033A-1%2520SOT-23&spm=wm.ssy.bg.0.stp&lcsc_vid=RVlWUQFUEwdfUgVfRQdXU1JeFFlaBFcDFVVaX1BTQFUxVlNfRVhaXldRT1NYUTsOAxUeFF5JWBYZEEoKFBINSQcJGk4eFQsCAgIaSgADAwAHC0swGA0aBgMDWiULEwEFAw4cFDsoFg8EDgoBWiwHBBYJWi4AAkkjGwQNSikjRVleUCVVRCxdIDslRVJYUFFTWQkaCgg%3D
U201 = LMR14006XDDCR: IC REG BUCK ADJ 600MA SOT23; Manufacturer: Texas Instruments; Suplier  Part Number: 296-44318-2-ND; Manufacturer product number: LMR14006XDDCR; ComponentLink1Description: DataSheep; ComponentLink1URL: https://www.ti.com/lit/ds/symlink/lmr14006.pdf?HQS=dis-dk-null-digikeymode-dsf-pf-null-wwe&ts=1794157197651; Supplier 1: Digikey; ComponentLink2Description: Digikey; ComponentLink2URL: https://www.digikey.com/en/products/detail/texas-instruments/LMR14006XDDCR/5176217?s=N4IgTCBcDaICoEkAEAZAsgJQIwBYAMeAbABoAipAwhiALoC%2BQA

## Nets that join several sheets
3V3: 1_SCH_Autolog (12 pins), 2_SCH_Autolog (C101.2 C103.1 U100.3 U102.5), 3_SCH_Autolog (9 pins)
GND: 1_SCH_Autolog (28 pins), 2_SCH_Autolog (16 pins), 3_SCH_Autolog (21 pins)
VCC: 2_SCH_Autolog (C100.2 D101.1 F100.1), 3_SCH_Autolog (8 pins)
3.3_SWITCHED: 1_SCH_Autolog (4.3), 2_SCH_Autolog (C102.1 U102.1)
BLUE_LED: 1_SCH_Autolog (U1.18), 3_SCH_Autolog (R214.1 R217.1)
CAN_H: 1_SCH_Autolog (J1.1), 2_SCH_Autolog (100.1 U100.7)
CAN_L: 1_SCH_Autolog (J1.2), 2_SCH_Autolog (R101.2 U100.6)
CAN_RS: 1_SCH_Autolog (U1.31), 2_SCH_Autolog (R100.2 U100.8)
CAN_RX: 1_SCH_Autolog (1.1 U1.21), 2_SCH_Autolog (U100.4)
CAN_TX: 1_SCH_Autolog (1.2 U1.22), 2_SCH_Autolog (U100.1)
FORCE_ON: 1_SCH_Autolog (U1.10), 3_SCH_Autolog (D200.2)
GREEN_LED: 1_SCH_Autolog (U1.4), 3_SCH_Autolog (R215.1 R218.2)
H_DRIVER: 1_SCH_Autolog (U1.23), 2_SCH_Autolog (U102.4)
RED_LED: 1_SCH_Autolog (U1.19), 3_SCH_Autolog (R216.1 R219.2)
SEN_ANALOG: 1_SCH_Autolog (U1.17), 3_SCH_Autolog (R209.1 R212.2)
SEN_DIGITAL: 1_SCH_Autolog (U1.12), 3_SCH_Autolog (D202.2)
USB_D_N: 1_SCH_Autolog (U1.13), 2_SCH_Autolog (U101.4)
USB_D_P: 1_SCH_Autolog (U1.14), 2_SCH_Autolog (U101.6)
VBUSS: 2_SCH_Autolog (D102.2 j101.A4/B9 j101.B4/A9 U101.5), 3_SCH_Autolog (D201.2)